# Altium schematic sheet Robot schematic.SchDoc
size 209 x 170 mm; SheetNumber: 1; SheetTotal: 1
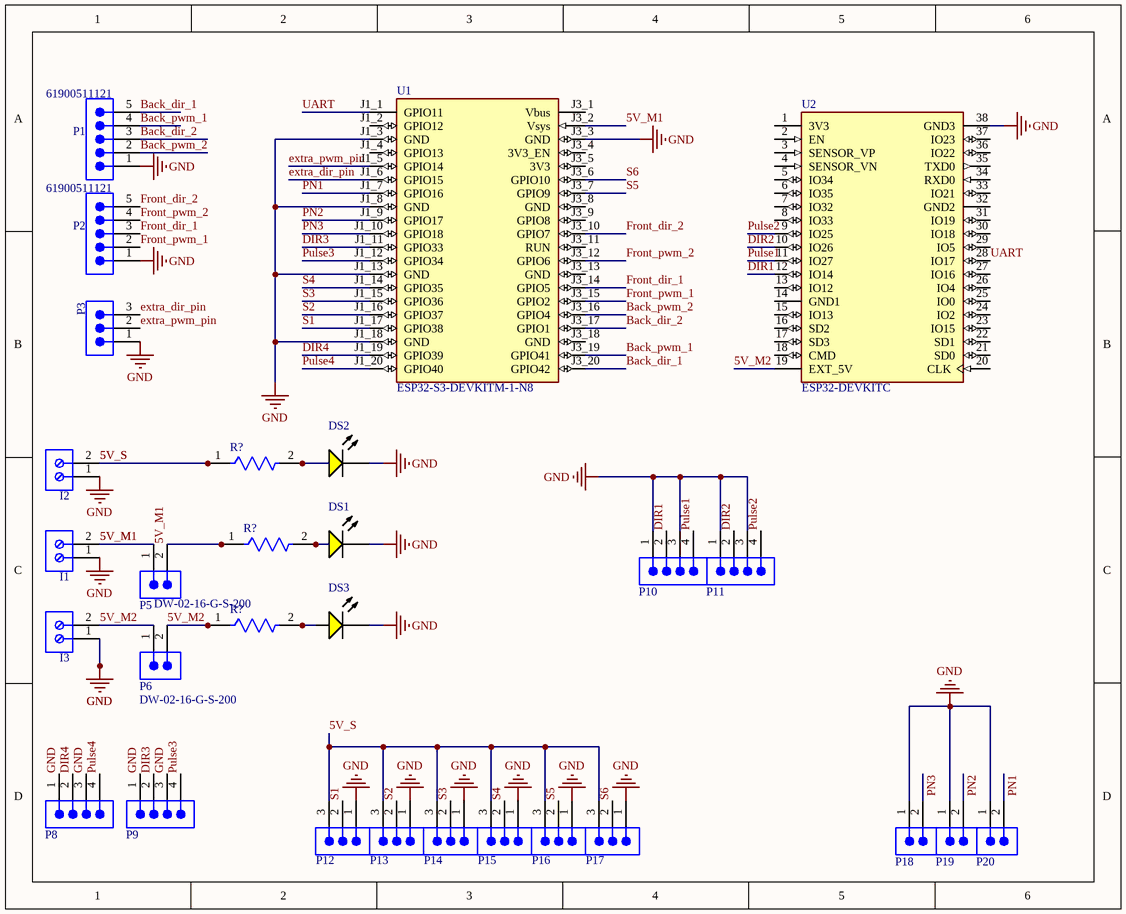
[diagram p0: Robot schematic.SchDoc]

## Parts
(Parts that share a designator on the sheet are numbered #1, #2 ... from top to bottom, then left to right.)
DS1  WP7113SYD  [KING-WP7113SYD_V]  (value not drawn)
DS2  WP7113SYD  [KING-WP7113SYD_V]  (value not drawn)
DS3  WP7113SYD  [KING-WP7113SYD_V]  (value not drawn)
I1  691211720002  [691211720002]  (value not drawn)
I2  691211720002  [691211720002]  (value not drawn)
I3  691211720002  [691211720002]  (value not drawn)
P1  61900511121  [61900511121]
P2  61900511121  [61900511121]
P3  61900311121  [61900311121]  (value not drawn)
P5  DW-02-16-G-S-200  [SMTC-DW-02-16-X-S-200]
P6  DW-02-16-G-S-200  [SMTC-DW-02-16-X-S-200]
P8  MTLW-104-07-L-S-125  [SMTC-MTLW-104-07-X-S-125]  (value not drawn)
P9  MTLW-104-07-L-S-125  [SMTC-MTLW-104-07-X-S-125]  (value not drawn)
P10  MTLW-104-07-L-S-125  [SMTC-MTLW-104-07-X-S-125]  (value not drawn)
P11  MTLW-104-07-L-S-125  [SMTC-MTLW-104-07-X-S-125]  (value not drawn)
P12  61900311121  [61900311121]  (value not drawn)
P13  61900311121  [61900311121]  (value not drawn)
P14  61900311121  [61900311121]  (value not drawn)
P15  61900311121  [61900311121]  (value not drawn)
P16  61900311121  [61900311121]  (value not drawn)
P17  61900311121  [61900311121]  (value not drawn)
P18  DW-02-16-G-S-200  [SMTC-DW-02-16-X-S-200]  (value not drawn)
P19  DW-02-16-G-S-200  [SMTC-DW-02-16-X-S-200]  (value not drawn)
P20  DW-02-16-G-S-200  [SMTC-DW-02-16-X-S-200]  (value not drawn)
R?#1  CF18JT10K0  [FP-CF18-MFG]  (value not drawn)
R?#2  CF18JT10K0  [FP-CF18-MFG]  (value not drawn)
R?#3  CF18JT10K0  [FP-CF18-MFG]  (value not drawn)
U1  ESP32-S3-DEVKITM-1-N8  [PCBComponent_1]
U2  ESP32-DEVKITC  [MODULE_ESP32-DEVKITC]

## Nets
GND: DS1.2(K) DS2.2(K) DS3.2(K) I1.1 I2.1 I3.1 P1.1 P2.1 P3.1 P8.1 P8.3 P9.1 P9.3 P10.1 P10.3 P11.1 P11.3 P12.1 P13.1 P14.1 P15.1 P16.1 P17.1 P18.1 P19.1 P20.1 U1.J1_3(GND) U1.J1_8(GND) U1.J1_13(GND) U1.J1_18(GND) U1.J3_3(GND) U2.38(GND3)
5V_M: I1.2 P5.1 P5.2 R?#2.1 U1.J3_2(Vsys)  [also labelled 5V_M1]
5V_M2: I3.2 P6.1 P6.2 R?#3.1 U2.19(EXT_5V)
5V_S: I2.2 P12.3 P13.3 P14.3 P15.3 P16.3 P17.3 R?#1.1
Back_dir_1: P1.5 U1.J3_20(GPIO42)
Back_dir_2: P1.3 U1.J3_17(GPIO1)
Back_pwm_1: P1.4 U1.J3_19(GPIO41)
Back_pwm_2: P1.2 U1.J3_16(GPIO4)
DIR1: P10.2 U2.12(IO14)
DIR2: P11.2 U2.10(IO26)
DIR3: P9.2 U1.J1_11(GPIO33)
DIR4: P8.2 U1.J1_19(GPIO39)
extra_dir_pin: P3.3 U1.J1_6(GPIO15)
extra_pwm_pin: P3.2 U1.J1_5(GPIO14)
Front_dir_1: P2.3 U1.J3_14(GPIO5)
Front_dir_2: P2.5 U1.J3_10(GPIO7)
Front_pwm_1: P2.2 U1.J3_15(GPIO2)
Front_pwm_2: P2.4 U1.J3_12(GPIO6)
PN1: P20.2 U1.J1_7(GPIO16)
PN2: P19.2 U1.J1_9(GPIO17)
PN3: P18.2 U1.J1_10(GPIO18)
Pulse1: P10.4 U2.11(IO27)
Pulse2: P11.4 U2.9(IO25)
Pulse3: P9.4 U1.J1_12(GPIO34)
Pulse4: P8.4 U1.J1_20(GPIO40)
S1: P12.2 U1.J1_17(GPIO38)
S2: P13.2 U1.J1_16(GPIO37)
S3: P14.2 U1.J1_15(GPIO36)
S4: P15.2 U1.J1_14(GPIO35)
S5: P16.2 U1.J3_7(GPIO9)
S6: P17.2 U1.J3_6(GPIO10)
UART: U1.J1_1(GPIO11) U2.28(IO17)
NetDS1_1: DS1.1(A) R?#2.2
NetDS2_1: DS2.1(A) R?#1.2
NetDS3_1: DS3.1(A) R?#3.2

Not connected (* = marked no-connect by the designer): U1 J1_2(GPIO12) J1_4(GPIO13) J3_1(Vbus) J3_4(3V3_EN) J3_5(3V3) J3_8(GND) J3_9(GPIO8) J3_11(RUN) J3_13(GND) J3_18(GND); U2 1(3V3) 2(EN) 3(SENSOR_VP) 4(SENSOR_VN) 5(IO34) 6(IO35) 7(IO32) 8(IO33) 13(IO12) 14(GND1) 15(IO13) 16(SD2) 17(SD3) 18(CMD) 20(CLK) 21(SD0) 22(SD1) 23(IO15) 24(IO2) 25(IO0) 26(IO4) 27(IO16) 29(IO5) 30(IO18) 31(IO19) 32(GND2) 33(IO21) 34(RXD0) 35(TXD0) 36(IO22) 37(IO23)

## Library data of the parts
DS1-DS3 = CMP-1757-00003-1: The Super Bright Yellow Device, 2 V, -40 to 85 degC, 2-Pin THD, RoHS, Tape and Reel; Tolerance: 1%; Power Rating: 250 mW; Voltage Rating: 250 V; Resistance: 22.1 kohm; Case\Package: Axial; Length: 0.248 inch; Max Operating Temperature: 155 degC; PackageDescription: 2-Pin Through Hole Device, Dia 5.9 mm, Body Length 8.6 mm; Package Quantity: 200; ComponentLink1Description: Datasheet; Mount: Through Hole; DatasheetVersion: Rev. 7B, 01/2015; RoHSCompliant: true; PackageReference: WP7113SYD; ComponentLink1URL: http://www.kingbrightusa.com/images/catalog/SPEC/WP7113SYD.pdf; Packaging: Bulk; Min Operating Temperature: -55 degC
I1-I3 = CMP-1502-02524-3: 211 Series 5MM Pitch Straight, Pcb Terminal Block, Through Hole, 2 Way; Number of Levels: 1; Current: 10A; Voltage: 300V; Pitch: 5.0038mm; Wire Gauge (Min): 12AWG; Connector Type: PCB, Terminal Block; Number of Positions Per Level: 2; Plating: Brass, Steel; Wire Gauge (Max): 24AWG; Stripping Length: -7mm; Termination: Screw; Height: 15.5mm; Contact Plating: Tin; REACH SVHC: Unknown; Contact Material: Brass; Width: 10mm; RoHS: Compliant; Number of Pins: 2; Lead Pitch: 5mm; Mount: Through Hole; Min Operating Temperature: -40°C; Length: 13.7mm; Number of Contacts: 2; Color: Green; Wire/Cable Gauge: 12AWG; Housing Material: Nylon; Packaging: Box; Max Operating Temperature: 105°C
P1 P2 = CMP-1502-00587-3: Wr-wtb Series, 2.54MM Pitch 5 Way 1 Row Straight Pcb Header, Through Hole; Contact Resistance: 20mΩ; Number of Contacts: 5; Operating Supply Voltage: 250V; Current Rating: 3A; Gender: Male; Insulation Resistance: 1GΩ; Connector Type: Male Pin; Fastening Type: Friction; Termination: Through Hole; Lead Pitch: 2.54mm; RoHS: Compliant; Contact Gender: Male; Width: 12.74mm; Mount: Through Hole; Color: Beige; Contact Material: Copper; Height: 12.5mm; Number of Pins: 5; Length: 12.7mm; Packaging: Bulk; Pitch: 2.54mm; Contact Mating Length: 7.493mm; Housing Material: Nylon; Max Operating Temperature: 105°C; Orientation: Vertical; Number of Rows: 1; Contact Plating: Tin; Voltage Rating: 250V; Flammability Rating: UL94 V-0; Number of Positions: 5; Lead Free: Lead Free; Min Operating Temperature: -40°C
P3 P12-P17 = CMP-1502-00585-3: Wr-wtb Series, 2.54MM Pitch 3 Way 1 Row Straight Pcb Header, Through Hole; Number of Contacts: 3; Contact Resistance: 20mΩ; Gender: Male; Connector Type: Male Pin; Voltage Rating: 250V; Insulation Resistance: 1GΩ; Current Rating: 3A; Width: 7.66mm; Mount: Through Hole; Pitch: 2.54mm; Housing Material: Nylon; Contact Mating Length: 7.493mm; Flammability Rating: UL94 V-0; Fastening Type: Friction; Height: 12.5mm; Number of Rows: 1; Orientation: Vertical; Packaging: Bulk; Contact Material: Copper; Max Operating Temperature: 105°C; Contact Plating: Tin; Operating Supply Voltage: 250V; Termination: Through Hole; Number of Pins: 3; Min Operating Temperature: -40°C; Contact Gender: Male; Color: Beige; RoHS: Compliant; Lead Pitch: 2.54mm; Length: 7.62mm; Number of Positions: 3
P5 P6 P18-P20 = CMP-1024-00001-1: Flexible .025" SQ Board Stacker, Through-hole, Vertical, -55 to 125 degC, 2.54 mm Pitch, 2-Pin, Male, RoHS; Manufacturer: Samtec; Pitch: 2.54 mm; ComponentLink1Description: Manufacturer URL; ComponentLink3Description: Package Specification; DatasheetVersion: F-214; PartNumber: DW-02-16-G-S-200; ComponentLink1URL: http://www.samtec.com; RoHS: True; PackageVersion: AX, 8/1984; ComponentLink2URL: http://www.samtec.com/documents/webfiles/pdf/DW.PDF; ComponentLink2Description: Datasheet; Orientation: Vertical; PackageReference: DW-02-16-X-S-200; PackageDescription: Low Cost Board Spacer; ComponentLink3URL: http://www.samtec.com/documents/webfiles/cpdf/XW-XX-XX-XXX-X-XXXX-XXX-XX-XXX-MKT1.PDF; Mounting Technology: Through-hole; Temperature Range: -55 to 125 degC
P8-P11 = CMP-1024-00072-1: Low Profile .025" SQ Post Header, Through-hole, Vertical, -55 to 125 degC, 2.54 mm Pitch, 4-Pin, Male, RoHS; Manufacturer: Samtec; Pitch: 2.54 mm; PackageDescription: Low Profile Terminal Assembly; PartNumber: MTLW-104-07-L-S-125; PackageReference: MTLW-104-07-X-S-125; ComponentLink1Description: Manufacturer URL; ComponentLink2Description: Datasheet; ComponentLink2URL: http://www.samtec.com/documents/webfiles/pdf/MTLW_TH.PDF; ComponentLink3Description: Package Specification; Mounting Technology: Through-hole; ComponentLink3URL: http://www.samtec.com/documents/webfiles/cpdf/MTLW-1XX-XX-XX-X-XXX-XX-XX-MKT1.pdf; ComponentLink1URL: http://www.samtec.com; Orientation: Vertical; PackageVersion: T, 6/1991; DatasheetVersion: F-214; Temperature Range: -55 to 125 degC; RoHS: True
R?#1-R?#3 = CMP-26528-000002-1: RES 10K OHM 1/8W 5% CF AXIAL; Manufacturer: Stackpole Electronics; Power Rating: 0.125W; Temperature Coefficient: 0-500ppm/°C; Resistance: 10kΩ; Voltage Rating: 250V; Value: 10kΩ; Temperature: -55°C to +155°C; Height: 2mm; Lead Free: Yes; Automotive: No; Device Class L2: Resistors; Package: CF18; Series: CF; ComponentLink2Description: Datasheet; Ipc Land Pattern Name: RESAD656W65L360D200; Manufacturer Part Number: CF18JT10K0; Temperature Range High: +155°C; RoHS: TRUE; Device Class L3: Through-Hole Resistors; Temperature Range Low: -55°C; Device Class L1: Passive Components; Category: Res; Octopart: https://octopart.com/cf18jt10k0-stackpole+electronics-19205642; Composition: Carbon Film; Digikey Description: RES 10K OHM 1/8W 5% CF AXIAL; ComponentLink2URL: http://www.seielect.com/Catalog/SEI-CF_CFM.pdf; Tolerance: 5%
U1 = ESP32-S3-PICO: MF: {'manufacturer': u'Espressif Systems'}; Package: None; Price: None; Value: *; MP: ESP32-S3-DEVKITM-1-N8; Availability: Unavailable
U2 = ESP32-DEVKITC: ESP32-WROOM-32UE series Transceiver; 802.11 b/g/n (Wi-Fi, WiFi, WLAN), Bluetooth Â® Smart Ready 4.x Dual Mode Evaluation Board; MF: Espressif Systems; SnapEDA_Link: https://www.snapeda.com/parts/ESP32-DEVKITC/Espressif+Systems/view-part/?ref=snap; Package: None; Value: *; MP: ESP32-DEVKITC; Check_prices: https://www.snapeda.com/parts/ESP32-DEVKITC/Espressif+Systems/view-part/?ref=eda